# Altium schematic sheet MPPT Circuit.SchDoc
size A
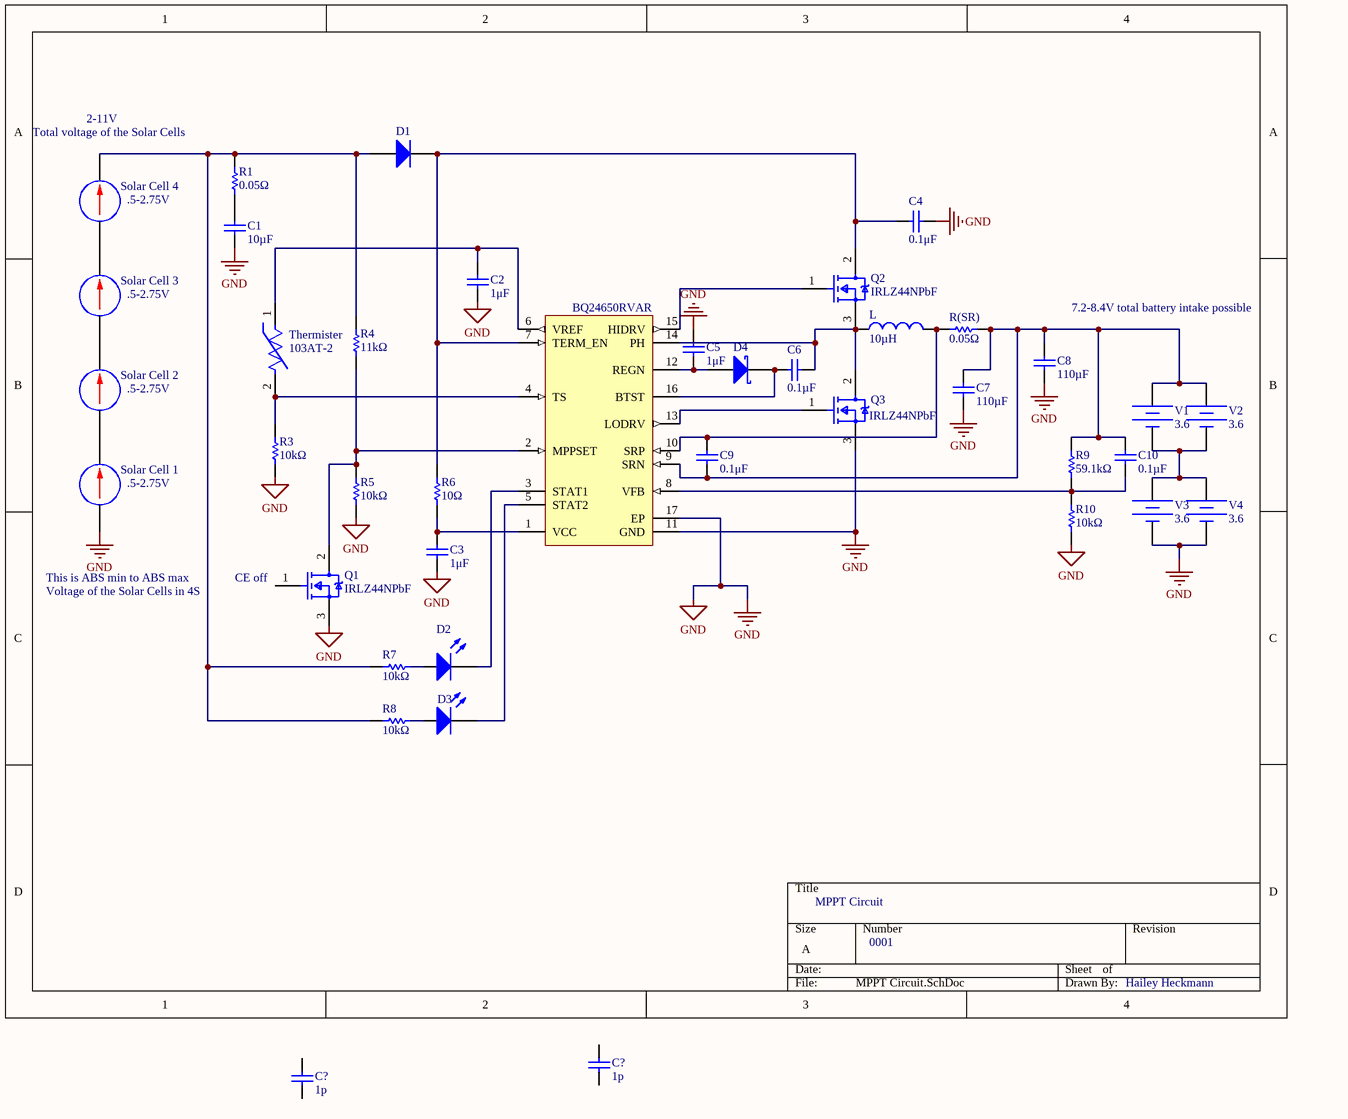
[diagram p0: MPPT Circuit.SchDoc]

## Parts
(Parts that share a designator on the sheet are numbered #1, #2 ... from top to bottom, then left to right.)
?  BQ24650RVAR  [RVA0016A_V]
C1  value 10µF  (hidden comment: Capacitor)
C2  value 1μF  (hidden comment: Capacitor)
C3  value 1μF  (hidden comment: Capacitor)
C4  value 0.1μF  (hidden comment: Capacitor)
C5  value 1μF  (hidden comment: Capacitor)
C6  value 0.1µF  (hidden comment: Capacitor)
C7  value 110µF  (hidden comment: Capacitor)
C8  value 110µF  (hidden comment: Capacitor)
C9  value 0.1μF  (hidden comment: Capacitor)
C10  value 0.1µF  (hidden comment: Capacitor)
C?#1  value 1p  (hidden comment: Capacitor)
C?#2  value 1p  (hidden comment: Capacitor)
D1  Diode  (value not drawn)
D2  Light-Emitting Diode  (value not drawn)
D3  Light-Emitting Diode  (value not drawn)
D4  Schottky Diode  (value not drawn)
L  value 10µH  (hidden comment: Inductor)
Q1  IRLZ44NPbF  [FP-PG-TO220-3-MFG]
Q2  IRLZ44NPbF  [FP-PG-TO220-3-MFG]
Q3  IRLZ44NPbF  [FP-PG-TO220-3-MFG]
R1  value 0.05Ω  (hidden comment: Resistor)
R3  value 10kΩ  (hidden comment: Resistor)
R4  value 11kΩ  (hidden comment: Resistor)
R5  value 10kΩ  (hidden comment: Resistor)
R6  value 10Ω  (hidden comment: Resistor)
R7  value 10kΩ  (hidden comment: Resistor)
R8  value 10kΩ  (hidden comment: Resistor)
R9  value 59.1kΩ  (hidden comment: Resistor)
R10  value 10kΩ  (hidden comment: Resistor)
R(SR)  value 0.05Ω  (hidden comment: Resistor)
Solar_Cell_1  DC: .5-2.75V  (hidden comment: DC Current Source)
Solar_Cell_2  DC: .5-2.75V  (hidden comment: DC Current Source)
Solar_Cell_3  DC: .5-2.75V  (hidden comment: DC Current Source)
Solar_Cell_4  DC: .5-2.75V  (hidden comment: DC Current Source)
Thermister  103AT-2  [FP-103AT-2-MFG]
V1  DC Magnitude: 3.6  (hidden comment: Constant Voltage Source)
V2  DC Magnitude: 3.6  (hidden comment: Constant Voltage Source)
V3  DC Magnitude: 3.6  (hidden comment: Constant Voltage Source)
V4  DC Magnitude: 3.6  (hidden comment: Constant Voltage Source)

## Nets
GND: ?.11(GND) ?.17(EP) C1.1 C2.1 C3.2 C4.1 C5.1 C7.1 C8.1 Q1.3(S) Q3.3(S) R3.1 R5.1 R10.1 Solar_Cell_1.2(-) V3.2 V4.2
Net?_1: ?.1(VCC) C3.1 R6.1
Net?_2: ?.2(MPPSET) Q1.2(D) R4.1 R5.2
Net?_3: ?.3(STAT1) D2.2(K)
Net?_4: ?.4(TS) R3.2 Thermister.2
Net?_5: ?.5(STAT2) D3.2(K)
Net?_6: ?.6(VREF) C2.2 Thermister.1
Net?_7: ?.7(TERM_EN) C4.2 D1.2(K) Q2.2(D) R6.2
Net?_8: ?.8(VFB) C10.1 R9.1 R10.2
Net?_9: ?.9(SRN) C7.2 C8.2 C9.1 C10.2 R9.2 R(SR).2 V1.1 V2.1
Net?_10: ?.10(SRP) C9.2 L.2 R(SR).1
Net?_12: ?.12(REGN) C5.2 D4.1(A)
Net?_13: ?.13(LODRV) Q3.1(G)
Net?_14: ?.14(PH) C6.2 L.1 Q2.3(S) Q3.2(D)
Net?_15: ?.15(HIDRV) Q2.1(G)
Net?_16: ?.16(BTST) C6.1 D4.2(K)
NetC1_2: C1.2 R1.1
NetD1_1: D1.1(A) R1.2 R4.2 R7.1 R8.1 Solar_Cell_4.1(+)
NetD2_1: D2.1(A) R7.2
NetD3_1: D3.1(A) R8.2
NetSolar_Cell_1_1: Solar_Cell_1.1(+) Solar_Cell_2.2(-)
NetSolar_Cell_2_1: Solar_Cell_2.1(+) Solar_Cell_3.2(-)
NetSolar_Cell_3_1: Solar_Cell_3.1(+) Solar_Cell_4.2(-)
NetV1_2: V1.2 V2.2 V3.1 V4.1

Not connected (* = marked no-connect by the designer): C?#1 1 2; C?#2 1 2; Q1 1(G)

## Notes on the sheet
- Total voltage of the Solar Cells
- 2-11V
- (near C8) 7.2-8.4V total battery intake possible
- This is ABS min to ABS max
- Voltage of the Solar Cells in 4S
- (near Q1) CE off
- MPPT Circuit
- 0001
- Hailey Heckmann

## Library data of the parts
? = CMP-0321-00204-2: High Efficiency Synchronous Switch-Mode Charger Controller- Solar Battery Charger, 5 V, -40 to 85 degC, 16-pin VQFN (RVA), Green (RoHS & no Sb/Br); Manufacturer: Texas Instruments; Li-Polymer: N; Vin(Min)(V): 5; SubFamily: Battery Charge Management; DatasheetVersion: SLUSA75; Mounting Technology: Surface Mount; PackageReference: RVA0016A; PackageDescription: 16-Pin Plastic Quad Flatpack No-Lead, 3.5 x 3.5 mm Body, 0.5 mm Pitch, Exposed Pad; Li-Ion: N; NiCd: N; PartNumber: BQ24650RVAR; ComponentLink1Description: Datasheet; Over Voltage Protection: N; PackageVersion: revC, May-2011; Eco-Plan: Green (RoHS & no Sb/Br); ComponentLink1URL: http://www.ti.com/general/docs/lit/getliterature.tsp?genericPartNumber=BQ24650&fileType=pdf; NiMH: N; Lead Acid: N
C1-C10 C?#1 C?#2 = Capacitor: SimulationGenericComponent: True
D1 = Diode: AF: 1; BV: 0; BV_MAX: 1e99; EG: 1.11; FC: 0.5; IBV: 0.001; ISR: 1e-14; MJSW: 0.33; NTUN: 30; TNOM: 27; XTI: 3; SimulationGenericComponent: True; CJO: 0; CJP: 0; CTA: 0; CTP: 0; FCS: 0.5; FV_MAX: 1e99; IKF: 0; IKR: 0; JSW: 0; JTUN: 0; JTUNSW: 0; KEG: 1; KF: 0; LEVEL: 1; N: 1; NBV: 1; NR: 1; NS: 1; PHP: 1; RS: 0; TCV: 0; TLEV: 0; TLEVC: 0; TM1: 0; TM2: 0; TPB: 0; TPHP: 0; TRS: 0; TRS2: 0; TT: 0; TTT1: 0; TTT2: 0; VJ: 1; XTITUN: 3; IS: 1e-14
D2 D3 = LED: AF: 1; BV: 0; BV_MAX: 1e99; EG: 1.11; FC: 0.5; IBV: 0.001; IS: 1e-14; MJSW: 0.33; NTUN: 30; TNOM: 27; XTI: 3; SimulationGenericComponent: True; CJO: 0; CJP: 0; CTA: 0; CTP: 0; FCS: 0.5; FV_MAX: 1e99; IKF: 0; IKR: 0; ISR: 1e-14; JSW: 0; JTUN: 0; JTUNSW: 0; KEG: 1; KF: 0; LEVEL: 1; N: 1; NBV: 1; NR: 1; NS: 1; PHP: 1; RS: 0; TCV: 0; TLEV: 0; TLEVC: 0; TM1: 0; TM2: 0; TPB: 0; TPHP: 0; TRS: 0; TRS2: 0; TT: 0; TTT1: 0; TTT2: 0; VJ: 1; XTITUN: 3
D4 = Schottky Diode: AF: 1; BV: 0; BV_MAX: 1e99; EG: 1.11; FC: 0.5; IBV: 0.001; IS: 1e-14; MJSW: 0.33; NTUN: 30; TNOM: 27; XTI: 3; SimulationGenericComponent: True; CJO: 0; CJP: 0; CTA: 0; CTP: 0; FCS: 0.5; FV_MAX: 1e99; IKF: 0; IKR: 0; ISR: 1e-14; JSW: 0; JTUN: 0; JTUNSW: 0; KEG: 1; KF: 0; LEVEL: 1; N: 1; NBV: 1; NR: 1; NS: 1; PHP: 1; RS: 0; TCV: 0; TLEV: 0; TLEVC: 0; TM1: 0; TM2: 0; TPB: 0; TPHP: 0; TRS: 0; TRS2: 0; TT: 0; TTT1: 0; TTT2: 0; VJ: 1; XTITUN: 3
L = Inductor: SimulationGenericComponent: True
Q1-Q3 = CMP-32901-000488-1: MOSFET N-CH 55V 47A TO220AB; Turn-On Delay Time: 11ns; Gate to Source Voltage (Vgs): 16V; Element Configuration: Single; Rds On Max: 22mR; Turn-Off Delay Time: 26ns; Max Power Dissipation: 110W; Threshold Voltage: 2V; Drain to Source Resistance: 35mR; Input Capacitance: 1.7nF; Continuous Drain Current (ID): 47A; Case/Package: TO-220; Lead Free: Lead Free; Halogen Free: Halogen Free; Packaging: Rail/Tube; Length: 0.414inch; Min Operating Temperature: -55°C; REACH SVHC: No SVHC; Number of Pins: 3; Width: 0.185inch; Drain to Source Voltage (Vdss): 55V; Power Dissipation: 110W; RoHS Compliant: Yes; Max Operating Temperature: 175°C; Height: 0.6inch; Max Dual Supply Voltage: 55V; Drain to Source Breakdown Voltage: 55V; Mount: Through Hole
R1 R3-R10 R(SR) = Resistor: TC1: 0; SimulationGenericComponent: True; TC2: 0
Solar_Cell_1-Solar_Cell_4 = DC Current Source: SimulationGenericComponent: True
Thermister = CMP-2000-05824-2: Thermistor NTC 10KOhm 1% 2-Pin; Resistance: 10kR; Lead Pitch: 2.54mm; Height: 2.4mm; Max Operating Temperature: 110°C; Width: 3.7mm; RoHS Compliant: Yes; Min Operating Temperature: -50°C; Termination: Radial; Packaging: Bulk; Number of Pins: 2; Series: AT; Tolerance: 1%; Length: 17mm
V1-V4 = Battery: SimulationGenericComponent: True